# Altium schematic sheet Power.schdoc
size 297 x 209 mm; Symbol: Drawing-Symbol_A4; @Project Name: Pedal Steel; @Page Count: 1; @Update Date: 2026-10-20; @Create Date: 2026-10-20; @Schematic Name: Schematic1; @Page No: 1; @Page Name: P1; Company: EasyEDA.com; Version: V1.0; Page Size: A4; Device: Drawing-Symbol_A4; @Create Time: 16:14:21; @Update Time: 16:14:21; Border: 1; Width: 1170; Height: 825; Region Start: 1; X Region Count: 6; Y Region Count: 4; Blade Width: 10; Title Block Position: 3; @Board Name: Board1
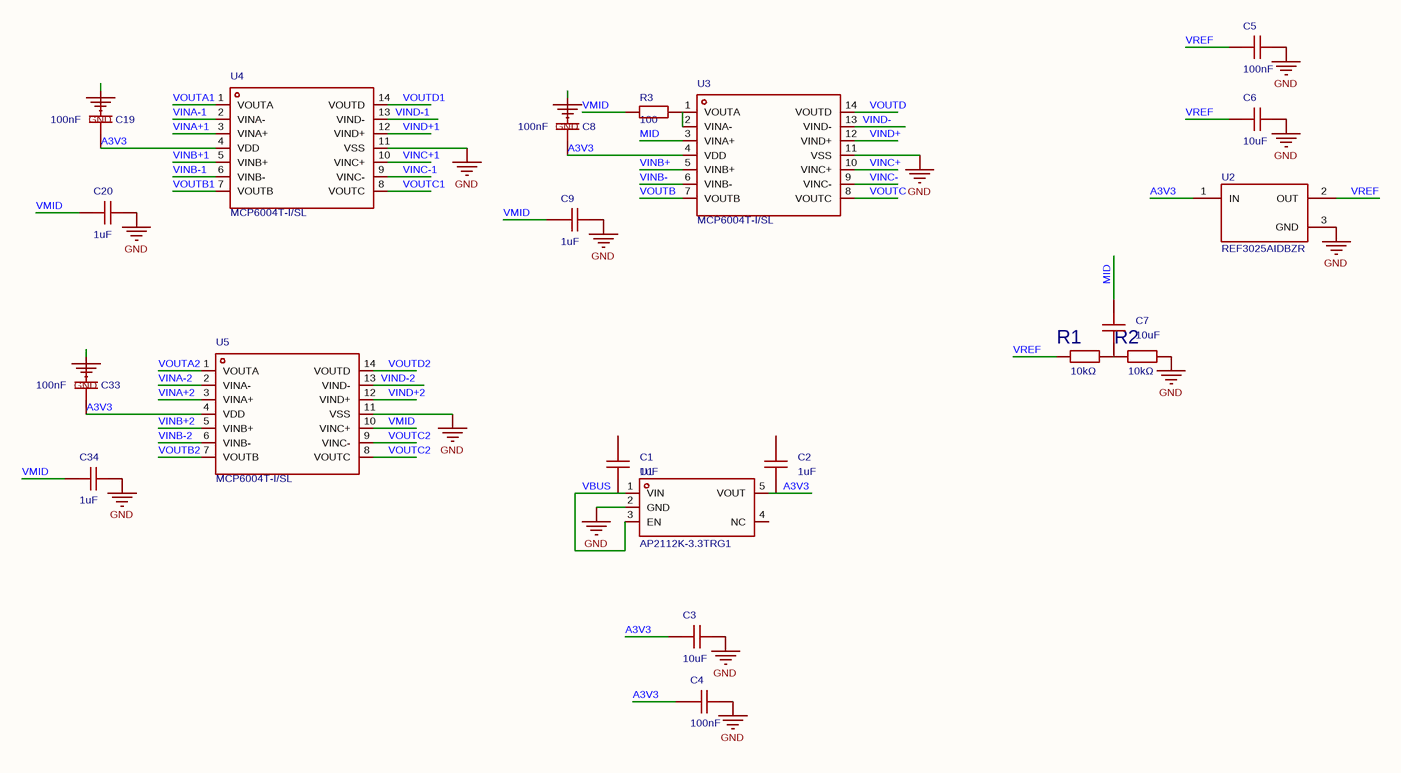
[diagram p0: Power.schdoc]

## Parts
C1  1uF  [C0603]
C2  1uF  [C0603]
C3  10uF  [C0603]
C4  100nF  [C0603]
C5  100nF  [C0603]
C6  10uF  [C0603]
C7  10uF  [C0603]
C8  100nF  [C0603]
C9  1uF  [C0603]
C19  100nF  [C0603]
C20  1uF  [C0603]
C33  100nF  [C0603]
C34  1uF  [C0603]
R1  10kΩ  [R0603]
R2  10kΩ  [R0603]
R3  100  [R0603]
U1  AP2112K-3.3TRG1  [SOT-25-5_L2.9-W1.6-P0.95-LS2.8-BL]
U2  REF3025AIDBZR  [SOT-23-3_L2.9-W1.6-P1.90-LS2.8-BR]
U3  MCP6004T-I/SL  [SOIC-14_L8.7-W3.9-P1.27-LS6.0-BL]
U4  MCP6004T-I/SL  [SOIC-14_L8.7-W3.9-P1.27-LS6.0-BL]
U5  MCP6004T-I/SL  [SOIC-14_L8.7-W3.9-P1.27-LS6.0-BL]

## Nets
GND: C3.1 C4.1 C5.1 C6.1 C8.1 C9.1 C19.1 C20.1 C33.1 C34.1 R2.2 U1.2(GND) U2.3(GND) U3.11(VSS) U4.11(VSS) U5.11(VSS)
A3V3: C2.2 C3.2 C4.2 C8.2 C19.2 C33.2 U1.5(VOUT) U2.1(IN) U3.4(VDD) U4.4(VDD) U5.4(VDD)
MID: C7.1 U3.3(VINA+)
VBUS: C1.2 U1.1(VIN) U1.3(EN)
VINA+1: U4.3(VINA+)
VINA+2: U5.3(VINA+)
VINA-1: U4.2(VINA-)
VINA-2: U5.2(VINA-)
VINB+: U3.5(VINB+)
VINB+1: U4.5(VINB+)
VINB+2: U5.5(VINB+)
VINB-: U3.6(VINB-)
VINB-1: U4.6(VINB-)
VINB-2: U5.6(VINB-)
VINC+: U3.10(VINC+)
VINC+1: U4.10(VINC+)
VINC-: U3.9(VINC-)
VINC-1: U4.9(VINC-)
VIND+: U3.12(VIND+)
VIND+1: U4.12(VIND+)
VIND+2: U5.12(VIND+)
VIND-: U3.13(VIND-)
VIND-1: U4.13(VIND-)
VIND-2: U5.13(VIND-)
VMID: C9.2 C20.2 C34.2 R3.1 U5.10(VINC+)
VOUTA1: U4.1(VOUTA)
VOUTA2: U5.1(VOUTA)
VOUTB: U3.7(VOUTB)
VOUTB1: U4.7(VOUTB)
VOUTB2: U5.7(VOUTB)
VOUTC: U3.8(VOUTC)
VOUTC1: U4.8(VOUTC)
VOUTC2: U5.8(VOUTC) U5.9(VINC-)
VOUTD: U3.14(VOUTD)
VOUTD1: U4.14(VOUTD)
VOUTD2: U5.14(VOUTD)
VREF: C5.2 C6.2 R1.1 U2.2(OUT)
NetC7_2: C7.2 R1.2 R2.1
NetR3_2: R3.2 U3.1(VOUTA) U3.2(VINA-)

Not connected (* = marked no-connect by the designer): C1 1; C2 1; U1 4(NC)

## Notes on the sheet
- Create at
- 2026-10-20
- Schematic
- Board
- Schematic1
- Board1
- Update at
- Page
- P1
- Drawn
- Reviewed
- Pedal Steel
- Version
- V1.0
- Size
- A4
- Page  1  Total  1
- EasyEDA.com

## Library data of the parts
C1-C9 C19 C20 C33 C34 = CAP_0603: Symbol: CAP_OLD; ConvertToPcb: yes; ModelId: 624118aa3cc7497086c383c2d72e08520819f05c4eef4c71ace90d822a990e87; ModelName: C0603_L1.6-W0.8-H0.8; ModelTransform: 62.992,31.496,0,0,0,0,0,0,0; Device: CAP_0603; AddInBom: yes; Supplier Footprint: 0603; FootprintName: C0603
  C1 C2 C9 C20 C34: Value: 1uF
  C3 C6 C7: Value: 10uF
  C4 C5 C8 C19 C33: Value: 100nF
R1 R2 = 0603WAF1002T5E: Type:Thick Film Resistor Resistance:10kΩ Tolerance:±1% Tolerance:±1% Power(Watts):100mW Voltage-Supply(Max):75V Temperature Coefficient:±100ppm/℃ Temperature Coefficient:±100ppm/℃ Operating Temperature:-55℃~+155℃ Operating Temperature:-55℃~+155℃; Manufacturer: UNI-ROYAL(厚声); AddInBom: yes; ModelId: 112863783b5b41f1b5254f87eedc79320819f05c4eef4c71ace90d822a990e87; ModelTransform: 31.8897,63.7794,0,90,0,0,0,0,0; Tolerance: ±1%; Power(Watts): 100mW; Voltage-Supply(Max): 75V; Symbol: 0603WAF1002T5E; Device: 0603WAF1002T5E; LCSC Part Name: 厚膜电阻 10kΩ ±1% 100mW; SupplierPart: C25804; ManufacturerPart: 0603WAF1002T5E; Supplier Footprint: 0603; JLCPCB Part Class: Basic Part; Datasheet: https://item.szlcsc.com/datasheet/0603WAF1002T5E/26547.html; Supplier: LCSC; ConvertToPcb: yes; FootprintName: R0603; ModelName: R0603; Type: Thick Film Resistor; Value: 10kΩ; Temperature Coefficient: ±100ppm/℃; Operating Temperature: -55℃~+155℃
R3 = Res_0603: Symbol: Res; ConvertToPcb: yes; ModelId: 112863783b5b41f1b5254f87eedc79320819f05c4eef4c71ace90d822a990e87; ModelTransform: 31.8897,63.7794,0,90,0,0,0,0,0; Device: Res_0603; Value: 100; AddInBom: yes; Supplier Footprint: 0603; FootprintName: R0603; ModelName: R0603
U1 = AP2112K-3.3TRG1: Output Configuration:Positive Voltage - Supply:6V Output Voltage:3.3V Output Voltage:3.3V Output Current:600mA Power Supply Rejection Ratio (PSRR):65dB@(1kHz) Voltage Dropout:250mV@(600mA) standby current:55uA Noise:50uVrms Features:Enable control；Short C; Manufacturer: DIODES(美台); AddInBom: yes; ModelId: 6177bbcd6fc94df4b4ba2f22405723a00819f05c4eef4c71ace90d822a990e87; ModelTransform: 114.173,110.236,0,0,0,0,0,0,0; Voltage - Supply: 6V; Output Voltage: 3.3V; standby current: 55uA; Output Type: Fixed; Number of Outputs: 1; Symbol: AP2112K-3.3TRG1; Device: AP2112K-3.3TRG1; LCSC Part Name: 3.3V 600mA 6V; SupplierPart: C51118; ManufacturerPart: AP2112K-3.3TRG1; Supplier Footprint: SOT-25-5; JLCPCB Part Class: Extended Part; Datasheet: https://item.szlcsc.com/datasheet/AP2112K-3.3TRG1/52131.html; Supplier: LCSC; ConvertToPcb: yes; FootprintName: SOT-25-5_L2.9-W1.6-P0.95-LS2.8-BL; ModelName: SOT-25-5_L2.9-W1.6-P0.95-LS2.8-BL; Output Configuration: Positive; Output Current: 600mA; Power Supply Rejection Ratio (PSRR): 65dB@(1kHz); Voltage Dropout: 250mV@(600mA); Noise: 50uVrms; Features: Enable control；Short Circuit Protection；Output discharge；Over Current Protection；Thermal shutdown; Operating Temperature: -40℃~+85℃@(Ta)
U2 = REF3025AIDBZR: Output Type:Fixed Voltage - Supply:2.55V~5.5V Voltage - Supply:2.55V~5.5V Output Voltage:2.5V Output Voltage:2.5V Output Current:25mA Tolerance:±0.2% Tolerance:±0.2% Temperature Coefficient:75ppm/℃ Reference Type:Series Quiescent Current:50uA Minimum Cath; Manufacturer: TI(德州仪器); AddInBom: yes; ModelId: 4eed685bb9f4439b846746bc2193f3c00819f05c4eef4c71ace90d822a990e87; ModelName: SOT-23-3L_L2.9-W1.6-H1.1-LS2.8-P0.95; ModelTransform: 114.173,110.236,0,90,0,0,0,0,0; Output Type: Fixed; Output Voltage: 2.5V; Output Current: 25mA; Tolerance: ±0.2%; Reference Type: Series; Quiescent Current: 50uA; Noise - 1/10Hz to 10Hz: 28uVp-p; Noise - 10Hz to 10kHz: 80uVrms; Symbol: REF3025AIDBZR; Device: REF3025AIDBZR; LCSC Part Name: 2.55V~5.5V 串联 50uA 75ppm/℃; SupplierPart: C11334; ManufacturerPart: REF3025AIDBZR; Supplier Footprint: SOT-23; JLCPCB Part Class: Extended Part; Datasheet: https://www.ti.com/lit/ds/symlink/ref30.pdf; Supplier: LCSC; ConvertToPcb: yes; FootprintName: SOT-23-3_L2.9-W1.6-P1.90-LS2.8-BR; Voltage - Supply: 2.55V~5.5V; Temperature Coefficient: 75ppm/℃; Minimum Cathode Current for Regulation: -; Operating Temperature: -40℃~+125℃; Features: -
U3-U5 = MCP6004T-I/SL: Number of Channels:4 Rail to Rail:Rail-to-Rail Input, Rail-to-Rail Output Gain Bandwidth Product:1MHz Vos - Input Offset Voltage:4.5mV Input Offset Voltage Drift(Vos TC):2uV/℃ Slew Rate:600V/ms Ib - Input Bias Current:1pA Input Offset Current(Ios):1pA Inp; Manufacturer: MICROCHIP(美国微芯); AddInBom: yes; ModelId: 4a4abff9a5634443a503282266e866970819f05c4eef4c71ace90d822a990e87; ModelName: SOIC-14_L8.6-W3.9-H1.8-LS6.0-P1.27; ModelTransform: 338.583,236.22,0,0,0,0,0,0.001,0; Number of Channels: 4; Gain Bandwidth Product: 1MHz; Vos - Input Offset Voltage: 4.5mV; Input Offset Voltage Drift(Vos TC): 2uV/℃; Ib - Input Bias Current: 1pA; Input Voltage Noise Density: 28nV/√Hz@1kHz; Common Mode Rejection Ratio(CMRR): 76dB; Quiescent Current: 100uA; Output Current: 23mA; Single supply: 1.8V~6V; Symbol: MCP6004T-I/SL; Device: MCP6004T-I/SL; LCSC Part Name: 1 MHz 低功耗运算放大器; SupplierPart: C7378; ManufacturerPart: MCP6004T-I/SL; Supplier Footprint: SOIC-14; JLCPCB Part Class: Extended Part; Datasheet: https://item.szlcsc.com/datasheet/MCP6004T-I%252FSL/7855.html; Supplier: LCSC; ConvertToPcb: yes; FootprintName: SOIC-14_L8.7-W3.9-P1.27-LS6.0-BL; Rail to Rail: Rail-to-Rail Input, Rail-to-Rail Output; Slew Rate: 600V/ms; Input Offset Current(Ios): 1pA; Operating Temperature: -40℃~+125℃; Dual Supply: -; Features: ESD protection